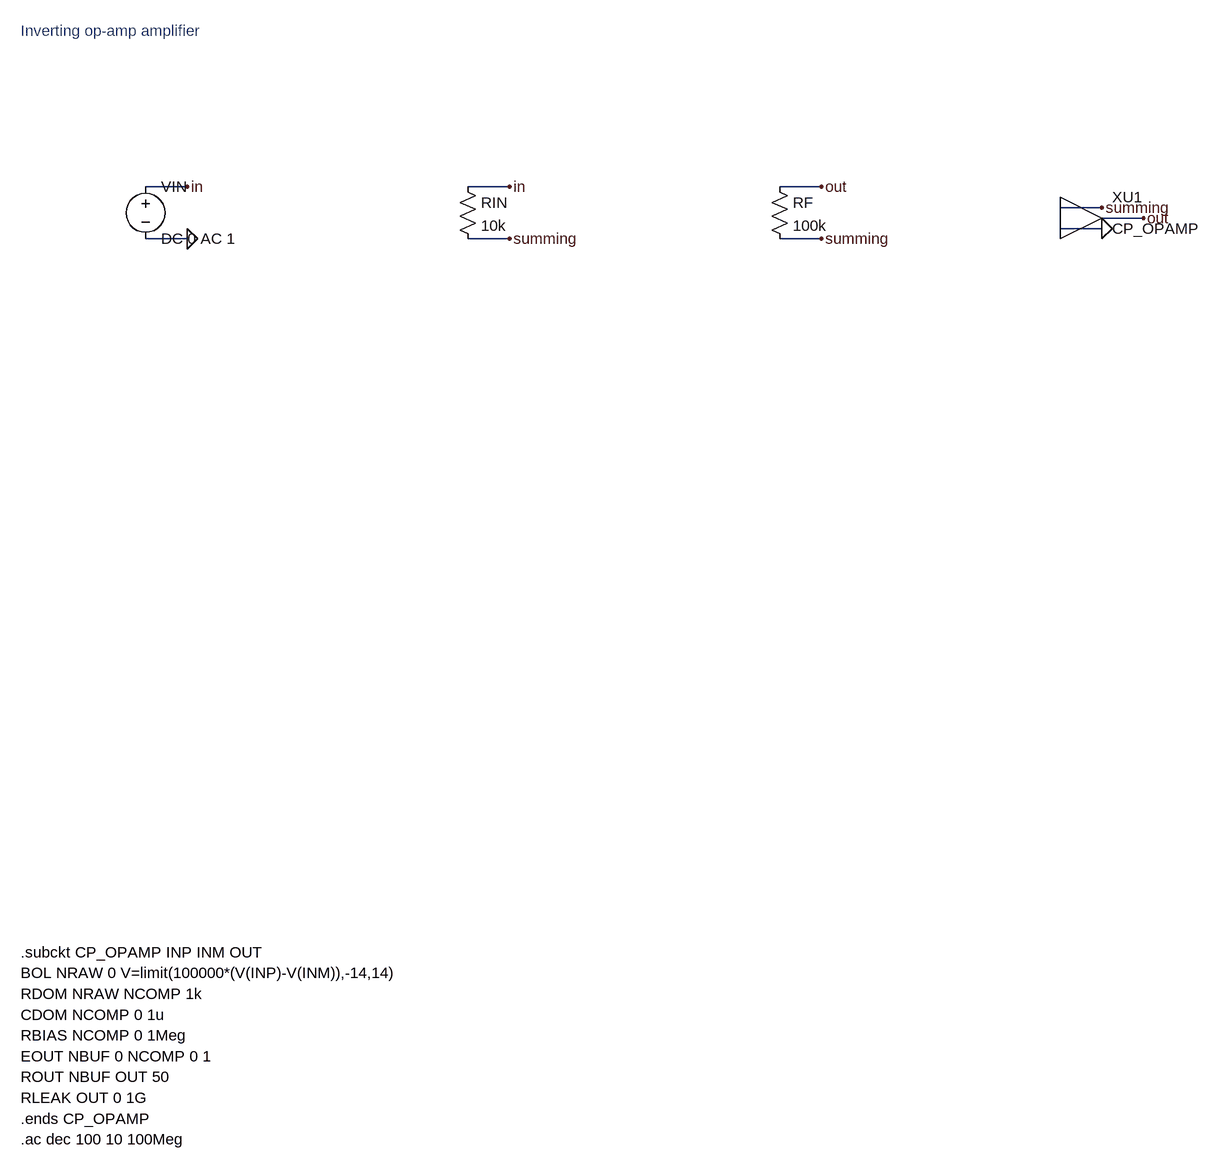
[diagram p0: schematic inverting-opamp-amplifier.asc]
inverting-opamp-amplifier.asc, the LTspice schematic file:
Version 4
SHEET 1 2400 2000
TEXT 64 32 Left 2 ;Inverting op-amp amplifier
SYMBOL voltage 256 256 R0
SYMATTR InstName VIN
SYMATTR Value DC 0 AC 1
WIRE 320 272 256 272
FLAG 320 272 in
WIRE 320 352 256 352
FLAG 320 352 0
SYMBOL res 736 256 R0
SYMATTR InstName RIN
SYMATTR Value 10k
WIRE 816 272 752 272
FLAG 816 272 in
WIRE 816 352 752 352
FLAG 816 352 summing
SYMBOL res 1216 256 R0
SYMATTR InstName RF
SYMATTR Value 100k
WIRE 1296 272 1232 272
FLAG 1296 272 out
WIRE 1296 352 1232 352
FLAG 1296 352 summing
SYMBOL CP_OPAMP 1696 256 R0
SYMATTR InstName XU1
SYMATTR Value CP_OPAMP
WIRE 1728 336 1664 336
FLAG 1728 336 0
WIRE 1728 304 1664 304
FLAG 1728 304 summing
WIRE 1792 320 1728 320
FLAG 1792 320 out
TEXT 64 1450 Left 2 !.subckt CP_OPAMP INP INM OUT
TEXT 64 1482 Left 2 !BOL NRAW 0 V=limit(100000*(V(INP)-V(INM)),-14,14)
TEXT 64 1514 Left 2 !RDOM NRAW NCOMP 1k
TEXT 64 1546 Left 2 !CDOM NCOMP 0 1u
TEXT 64 1578 Left 2 !RBIAS NCOMP 0 1Meg
TEXT 64 1610 Left 2 !EOUT NBUF 0 NCOMP 0 1
TEXT 64 1642 Left 2 !ROUT NBUF OUT 50
TEXT 64 1674 Left 2 !RLEAK OUT 0 1G
TEXT 64 1706 Left 2 !.ends CP_OPAMP
TEXT 64 1738 Left 2 !.ac dec 100 10 100Meg

The netlist it stands for:
* inverting-opamp-amplifier.asc
VIN in 0 DC 0 AC 1
RIN in summing 10k
RF out summing 100k
XXU1 0 summing out CP_OPAMP  ; pins INP INM OUT
* Inverting op-amp amplifier
.subckt CP_OPAMP INP INM OUT
BOL NRAW 0 V=limit(100000*(V(INP)-V(INM)),-14,14)
RDOM NRAW NCOMP 1k
CDOM NCOMP 0 1u
RBIAS NCOMP 0 1Meg
EOUT NBUF 0 NCOMP 0 1
ROUT NBUF OUT 50
RLEAK OUT 0 1G
.ends CP_OPAMP
.ac dec 100 10 100Meg
.backanno
.end